# Altium project B2B_Charger.PrjPcb (part 1 of 3)
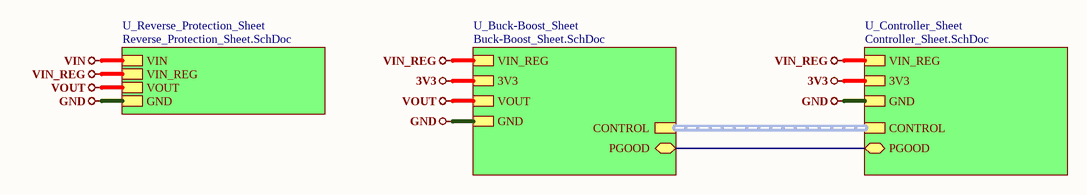
[diagram p0: Top_Sheet.SchDoc]
4 sheets, 112 parts. Net scope: hierarchical (ports join the sheet entries above them; power ports are global).
Sheets:
  Top_Sheet.SchDoc
    U_Controller_Sheet = Controller_Sheet.SchDoc
    U_Buck-Boost_Sheet = Buck-Boost_Sheet.SchDoc
    U_Reverse_Protection_Sheet = Reverse_Protection_Sheet.SchDoc

## Sheet Top_Sheet.SchDoc
size 420 x 297 mm; SheetNumber: 1; SheetTotal: 3

### Sub-sheets
U_Buck-Boost_Sheet = Buck-Boost_Sheet.SchDoc: CONTROL (harness CONTROL), PGOOD (bidir), GND, 3V3, VOUT, VIN_REG
U_Controller_Sheet = Controller_Sheet.SchDoc: CONTROL (harness CONTROL), PGOOD (bidir), GND, 3V3, VIN_REG
U_Reverse_Protection_Sheet = Reverse_Protection_Sheet.SchDoc: GND, VIN_REG, VIN, VOUT

### Nets
3V3: sheet U_Controller_Sheet/3V3, sheet U_Buck-Boost_Sheet/3V3
GND: sheet U_Controller_Sheet/GND, sheet U_Buck-Boost_Sheet/GND, sheet U_Reverse_Protection_Sheet/GND
VIN_REG: sheet U_Controller_Sheet/VIN_REG, sheet U_Buck-Boost_Sheet/VIN_REG, sheet U_Reverse_Protection_Sheet/VIN_REG
VOUT: sheet U_Buck-Boost_Sheet/VOUT, sheet U_Reverse_Protection_Sheet/VOUT
PGOOD: sheet U_Controller_Sheet/PGOOD, sheet U_Buck-Boost_Sheet/PGOOD

### Buses and harness runs
harness sheet U_Buck-Boost_Sheet/CONTROL = sheet U_Controller_Sheet/CONTROL

### Notes on the sheet
- File:
- Title:
- Date:
- Page
- Num:
- Total:
- Drawn By: Huzaifa Ali

## Sheet Controller_Sheet.SchDoc
size 420 x 297 mm; SheetNumber: 4; SheetTotal: 4
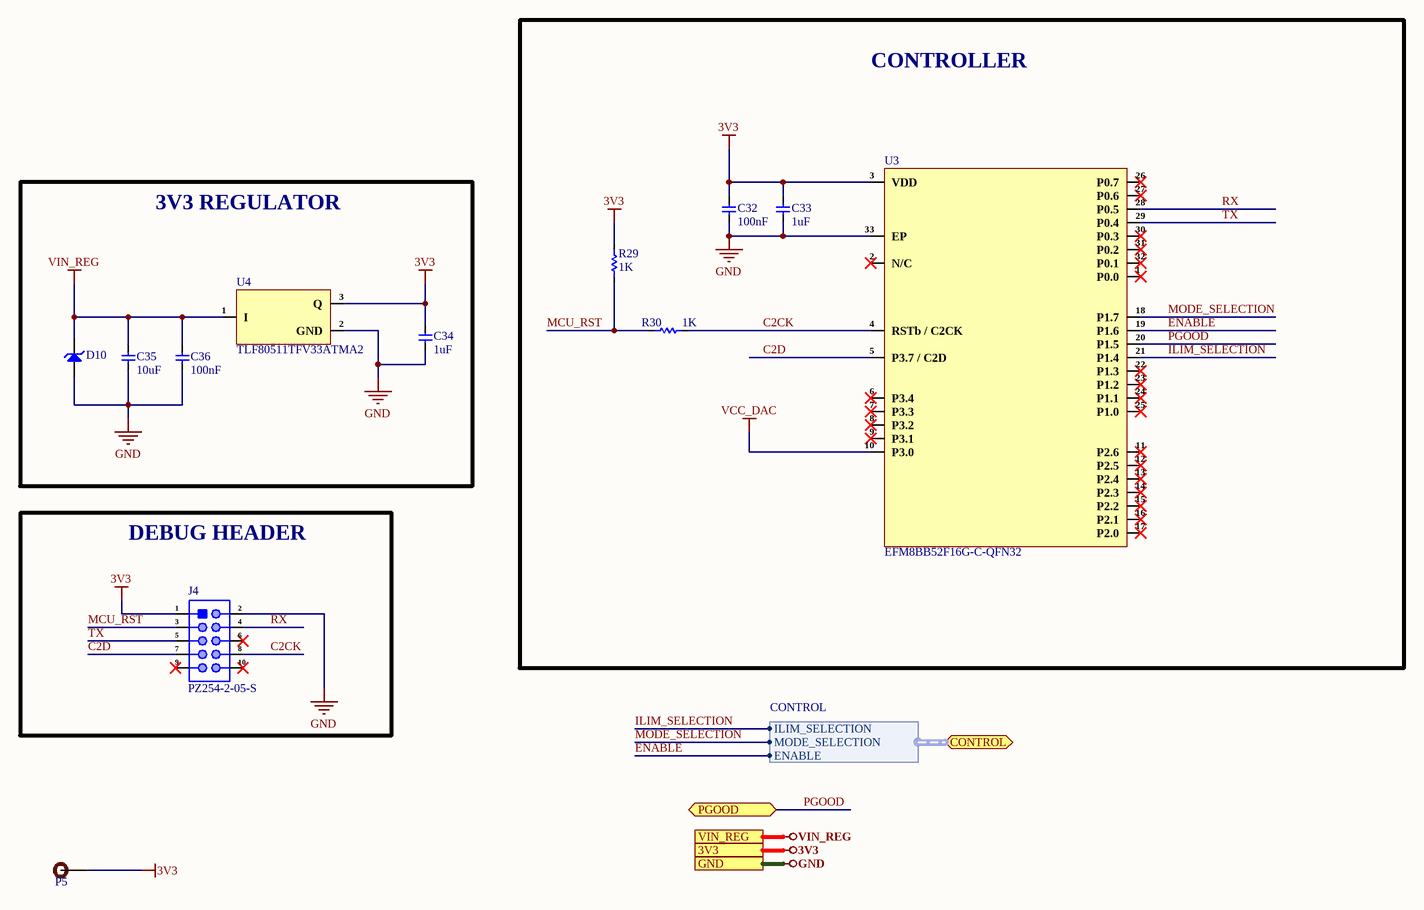
[diagram p1: Controller_Sheet.SchDoc]

### Parts
C32  100nF  [Cap-0603]
C33  1uF  [Cap-0603]
C34  1uF  [Cap-0603]
C35  10uF  [Cap-1206]
C36  100nF  [Cap-0603]
D10  1SMA5937BT3G  [SMA]  (value not drawn)
J4  PZ254-2-05-S  [PZ254-2-05-S]
P5  TEST POINT  [Test-point]  (value not drawn)  (no BOM)
R29  1K  [Res-0603]
R30  1K  [Res-0603]
U3  EFM8BB52F16G-C-QFN32  [32-QFN (5x5)]
U4  TLF80511TFV33ATMA2  [TO-252-2L]

### Blocks framed on the sheet
CONTROLLER: C32 C33 R29 R30 U3
3V3 REGULATOR: C34-C36 D10 U4
DEBUG HEADER: J4

### Ports
3V3, CONTROL (bidir, harness CONTROL), GND, PGOOD (bidir), VIN_REG

### Harnesses
CONTROL: ILIM_SELECTION, MODE_SELECTION, ENABLE

### Nets
3V3: C32.2 C33.2 C34.2 J4.1 P5.1 R29.2 U3.3(VDD) U4.3(Q) ; port 3V3
GND: C32.1 C33.1 C34.1 C35.1 C36.1 D10.2(A) J4.2 U3.33(EP) U4.2(GND) ; port GND
VCC_DAC: U3.10(P3.0)
VIN_REG: C35.2 C36.2 D10.1(K) U4.1(I) ; port VIN_REG
C2CK: J4.8 R30.2 U3.4(RSTb_/_C2CK)
C2D: J4.7 U3.5(P3.7_/_C2D)
ENABLE: U3.19(P1.6) ; port CONTROL.ENABLE
ILIM_SELECTION: U3.21(P1.4) ; port CONTROL.ILIM_SELECTION
MCU_RST: J4.3 R29.1 R30.1
MODE_SELECTION: U3.18(P1.7) ; port CONTROL.MODE_SELECTION
PGOOD: U3.20(P1.5) ; port PGOOD
RX: J4.4 U3.28(P0.5)
TX: J4.5 U3.29(P0.4)

Not connected (* = marked no-connect by the designer): J4 6* 9* 10*; U3 1(P0.0)* 2(N/C)* 6(P3.4)* 7(P3.3)* 8(P3.2)* 9(P3.1)* 11(P2.6)* 12(P2.5)* 13(P2.4)* 14(P2.3)* 15(P2.2)* 16(P2.1)* 17(P2.0)* 22(P1.3)* 23(P1.2)* 24(P1.1)* 25(P1.0)* 26(P0.7)* 27(P0.6)* 30(P0.3)* 31(P0.2)* 32(P0.1)*

### Notes on the sheet
- File:
- Title:
- Date:
- Page
- Num:
- Total:
- Drawn By: Huzaifa Ali

### Library data of the parts
C32 C36 = CC0603KRX5R9BB104: CAP CER 0.1UF 50V X5R 0603; Manufacturer: Yageo; Tolerance: 10%; Item Type: Capacitor; Supplier 1: Digi-Key; Manufacturer Part Number: CC0603KRX5R9BB104; RoHS: Yes; Category: Ceramic Capacitors; Stock 1: 152253; Pricing 1: 1=0.10000, 10=0.05200, 50=0.02820, 100=0.02310, 500=0.01648, 1000=0.01294 (USD); Mount: Surface Mount; Case/Package: 0603; Case Code (Imperial): 0603; Case Code (Metric): 1608; Weight: 7.1E-05oz; Min Operating Temperature: -55°C; Max Operating Temperature: 85°C; Capacitance: 100nF; Packaging: Tape and Reel; Voltage Rating: 50V; Dielectric: X5R; Termination: SMD/SMT; Voltage Rating (DC): 50V; Package Quantity: 4000; Length: 0.063inch; Width: 0.031inch; Thickness: 0.035inch; Lead Free: Lead Free; Halogen Free: Halogen Free; ComponentLink1URL: http://www.mouser.com/ds/2/447/Yageo_UPY-GP_NP0_16V-to-50V_9-358835.pdf?src-supplier=Mouser; ComponentLink1Description: http://www.mouser.com/ds/2/447/Yageo_UPY-GP_NP0_16V-to-50V_9-358835.pdf?src-supplier=Mouser; ComponentLink2URL: https://www.yageo.com/upload/media/product/productsearch/datasheet/mlcc/UPY-GPHC_X5R_4V-to-50V_26.pdf?src-supplier=Digi-Key; ComponentLink2Description: https://www.yageo.com/upload/media/product/productsearch/datasheet/mlcc/UPY-GPHC_X5R_4V-to-50V_26.pdf?src-supplier=Digi-Key; ComponentLink3URL: http://www.yageo.com/exep/pages/download/literatures/ProductSelectionGuide%202014_Final_2.pdf?src-supplier=Digi-Key; ComponentLink3Description: http://www.yageo.com/exep/pages/download/literatures/ProductSelectionGuide%202014_Final_2.pdf?src-supplier=Digi-Key; Supplier Part Number 1: 311-4046-1-ND; LCSC Part Number: C110022
C33 C34 = CC0603KRX5R8BB105: CAP CER 1UF 25V X5R 0603; Manufacturer: Yageo; Tolerance: 10%; Item Type: Capacitor; Supplier 1: Digi-Key; Manufacturer Part Number: CC0603KRX5R8BB105; RoHS: Yes; Category: Ceramic Capacitors; Stock 1: 919939; Pricing 1: 1=0.12000, 10=0.08400, 50=0.04760, 100=0.03940, 500=0.02764, 1000=0.02288 (USD); Mount: Surface Mount; Case/Package: 0603; Number of Pins: 2; Case Code (Metric): 1608; Case Code (Imperial): 0603; Min Operating Temperature: -55°C; Max Operating Temperature: 85°C; Capacitance: 1uF; Dielectric: X5R; Package Quantity: 1; Voltage Rating: 25V; Packaging: Tape and Reel; Termination: SMD/SMT; Voltage Rating (DC): 25V; Series: CC; Construction: Flat; Length: 1.6mm; Width: 0.031inch; Height: 0.8mm; Thickness: 0.035inch; Depth: 0.8mm; Radiation Hardening: No; REACH SVHC: No SVHC; Lead Free: Lead Free; Halogen Free: Halogen Free; RoHS Compliant: Yes; ComponentLink1URL: https://datasheet.ciiva.com/176/mlccorderingcode-176785.pdf?src-supplier=Digi-Key; ComponentLink1Description: https://datasheet.ciiva.com/176/mlccorderingcode-176785.pdf?src-supplier=Digi-Key; ComponentLink2URL: https://datasheet.ciiva.com/176/mlccorderingcode-176786.pdf?src-supplier=Digi-Key; ComponentLink2Description: https://datasheet.ciiva.com/176/mlccorderingcode-176786.pdf?src-supplier=Digi-Key; ComponentLink3URL: https://datasheet.ciiva.com/176/mlccorderingcode-176787.pdf?src-supplier=Digi-Key; ComponentLink3Description: https://datasheet.ciiva.com/176/mlccorderingcode-176787.pdf?src-supplier=Digi-Key; ComponentLink4URL: https://datasheet.ciiva.com/17436/upy-gphc-x5r-4v-to-50v-12-17436952.pdf?src-supplier=Avnet+Europe; ComponentLink4Description: https://datasheet.ciiva.com/17436/upy-gphc-x5r-4v-to-50v-12-17436952.pdf?src-supplier=Avnet+Europe; ComponentLink5URL: https://datasheet.ciiva.com/7978/1525783-7978171.pdf?src-supplier=Element14; ComponentLink5Description: https://datasheet.ciiva.com/7978/1525783-7978171.pdf?src-supplier=Element14; ComponentLink6URL: https://datasheet.ciiva.com/11586/upy-gphc-x5r-4v-to-50v-12-11586318.pdf?src-supplier=Avnet; ComponentLink6Description: https://datasheet.ciiva.com/11586/upy-gphc-x5r-4v-to-50v-12-11586318.pdf?src-supplier=Avnet; Supplier Part Number 1: 311-1445-1-ND; LCSC Part Number: C14664
C35 = CC1206KKX5R8BB106: CAP CER 10UF 25V X5R 1206; Manufacturer: Yageo; Tolerance: 10%; Supplier 1: Digi-Key; Manufacturer Part Number: CC1206KKX5R8BB106; RoHS: Yes; Category: Ceramic Capacitors; Stock 1: 206954; Pricing 1: 1=0.56000, 10=0.39800, 50=0.30080, 100=0.26190, 500=0.19402, 1000=0.16492 (USD); Mount: Surface Mount; Case/Package: 1206; Number of Pins: 2; Case Code (Imperial): 1206; Case Code (Metric): 3216; Min Operating Temperature: -55°C; Max Operating Temperature: 85°C; Capacitance: 10uF; Dielectric: X5R; Packaging: Tape and Reel; Voltage Rating: 25V; Package Quantity: 1; Termination: SMD/SMT; Voltage Rating (DC): 25V; Series: CC; Construction: Flat; Length: 3.2mm; Width: 0.063inch; Height: 1.6mm; Thickness: 0.071inch; Depth: 1.6mm; Radiation Hardening: No; Lead Free: Lead Free; Halogen Free: Halogen Free; RoHS Compliant: Yes; ComponentLink1URL: https://datasheet.ciiva.com/184/mlccorderingcode-184043.pdf?src-supplier=Digi-Key; ComponentLink1Description: https://datasheet.ciiva.com/184/mlccorderingcode-184043.pdf?src-supplier=Digi-Key; ComponentLink2URL: https://datasheet.ciiva.com/184/mlccorderingcode-184042.pdf?src-supplier=Digi-Key; ComponentLink2Description: https://datasheet.ciiva.com/184/mlccorderingcode-184042.pdf?src-supplier=Digi-Key; ComponentLink3URL: https://datasheet.ciiva.com/184/mlccorderingcode-184044.pdf?src-supplier=Digi-Key; ComponentLink3Description: https://datasheet.ciiva.com/184/mlccorderingcode-184044.pdf?src-supplier=Digi-Key; ComponentLink4URL: https://datasheet.ciiva.com/11466/upy-gphc-x5r-4v-to-50v-12-11466558.pdf?src-supplier=Avnet; ComponentLink4Description: https://datasheet.ciiva.com/11466/upy-gphc-x5r-4v-to-50v-12-11466558.pdf?src-supplier=Avnet; ComponentLink5URL: https://datasheet.ciiva.com/15189/getdatasheetpartid-344055-15189254.pdf?src-supplier=Verical; ComponentLink5Description: https://datasheet.ciiva.com/15189/getdatasheetpartid-344055-15189254.pdf?src-supplier=Verical; Supplier Part Number 1: 311-1466-1-ND
D10 = 1SMA5937BT3G: DIODE ZENER 33V 1.5W SMA; Manufacturer: ON Semiconductor; Supplier: Rs; Supplier Part Number: 7925363; Manufacturer Part Number: 1SMA5937BT3G; RoHS: Yes; Category: Zener Diodes; Stock: 3380; Pricing: 20=0.231, 100=0.164, 200=0.159, 400=0.154, 800=0.152 (GBP); ComponentLink1URL: https://datasheet.ciiva.com/30478/0900766b8127698c-30478606.pdf?src-supplier=Rs; ComponentLink1Description: https://datasheet.ciiva.com/30478/0900766b8127698c-30478606.pdf?src-supplier=Rs; ComponentLink2URL: https://datasheet.ciiva.com/1182/1sma5913bt3-d-1182598.pdf?src-supplier=Element14; ComponentLink2Description: https://datasheet.ciiva.com/1182/1sma5913bt3-d-1182598.pdf?src-supplier=Element14; ComponentLink3URL: https://datasheet.ciiva.com/1182/1sma5913bt3-d-1182599.pdf?src-supplier=Element14; ComponentLink3Description: https://datasheet.ciiva.com/1182/1sma5913bt3-d-1182599.pdf?src-supplier=Element14; Item Type: Diode
J4 = PZ254-2-05-S: 250V 3A Brick nogging Square Pins 2.5mm 260℃@5S 6mm 10P -40℃~+105℃ 2.54mm 双排 Black 2.54mm 2x5P SMD,P=2.54mm Pin Headers ROHS; Manufacturer: HCTL; Item Type: Male Header; Manufacturer Part Number: PZ254-2-05-S; LCSC Part Number: C3294463
P5 = TEST POINT: Test Point ON; Item Type: TEST POINT
R29 R30 = RT0603BRD071KL: RES SMD 1K OHM 0.1% 1/10W 0603; Manufacturer: Yageo; Resistance: 1kR; Power Rating: 100mW; Voltage Rating: 75V; Temperature Coefficient: 25ppm/°C; Voltage Rating (DC): 50V; Item Type: Resistor; Supplier 1: Arrow Electronics; Manufacturer Part Number: RT0603BRD071KL; RoHS: Yes; Category: Chip SMD Resistors; Stock 1: 130000; Pricing 1: 5000=0.03900, 10000=0.03450, 25000=0.03070, 50000=0.02040 (USD); Mount: Surface Mount; Case/Package: 0603; Case Code (Metric): 1608; Case Code (Imperial): 0603; Contact Plating: Tin,Lead; Size Code: 0603; Min Operating Temperature: -55°C; Max Operating Temperature: 125°C; Package Quantity: 5000; Packaging: Tape and Reel; Resistor Type: Thin Film; Number of Terminations: 2; Termination: SMD/SMT; Max Power Dissipation: 100mW; Features: Moisture Resistant; Series: RT; Technology: THIN FILM; Construction: Rectangular; Length: 1.6mm; Width: 0.031inch; Height: 0.022inch; Depth: 0.8mm; Military Standard: Not; Lead Free: Lead Free; RoHS Compliant: Yes; ComponentLink1URL: https://datasheet.ciiva.com/11819/0900766b8079c86e-11819652.pdf?src-supplier=RSComponents; ComponentLink1Description: https://datasheet.ciiva.com/11819/0900766b8079c86e-11819652.pdf?src-supplier=RSComponents; ComponentLink2URL: https://datasheet.ciiva.com/5624/pyu-rt-1-to-0-05-rohs-l-4-5624759.pdf?src-supplier=Mouser; ComponentLink2Description: https://datasheet.ciiva.com/5624/pyu-rt-1-to-0-05-rohs-l-4-5624759.pdf?src-supplier=Mouser; ComponentLink3URL: https://datasheet.ciiva.com/29718/pyu-rt-1-to-0-05-rohs-l-4-29718010.pdf?src-supplier=Digi-Key; ComponentLink3Description: https://datasheet.ciiva.com/29718/pyu-rt-1-to-0-05-rohs-l-4-29718010.pdf?src-supplier=Digi-Key; ComponentLink4URL: https://datasheet.ciiva.com/29718/pyu-rt-1-to-0-05-rohs-l-4-29718011.pdf?src-supplier=Digi-Key; ComponentLink4Description: https://datasheet.ciiva.com/29718/pyu-rt-1-to-0-05-rohs-l-4-29718011.pdf?src-supplier=Digi-Key; Supplier Part Number 1: RT0603BRD071KL; LCSC Part Number: C110776
U3 = EFM8BB52F16G-C-QFN32: IC MCU 8BIT 16KB FLASH 32QFN; Manufacturer: Silicon Labs; Supplier: Arrow Electronics; Supplier Part Number: EFM8BB52F16G-C-QFN32; Manufacturer Part Number: EFM8BB52F16G-C-QFN32; RoHS: No; Category: Uncategorized; Stock: 540; Pricing: 1=0.5847, 10=0.5643, 100=0.5088, 600=0.5037, 1000=0.48 (USD); Item Type: IC
U4 = TLF80511TFV33ATMA2: IC REG LIN 3.3V 400MA TO252-3-11; Manufacturer: Infineon; Supplier: Future Electronics; Supplier Part Number: 6060699; Manufacturer Part Number: TLF80511TFV33ATMA2; RoHS: Yes; Pricing: 2500=0.745 (USD); RoHS Compliant: Yes; Item Type: IC

## Sheet Buck-Boost_Sheet.SchDoc
size 420 x 297 mm; SheetNumber: 3; SheetTotal: 4
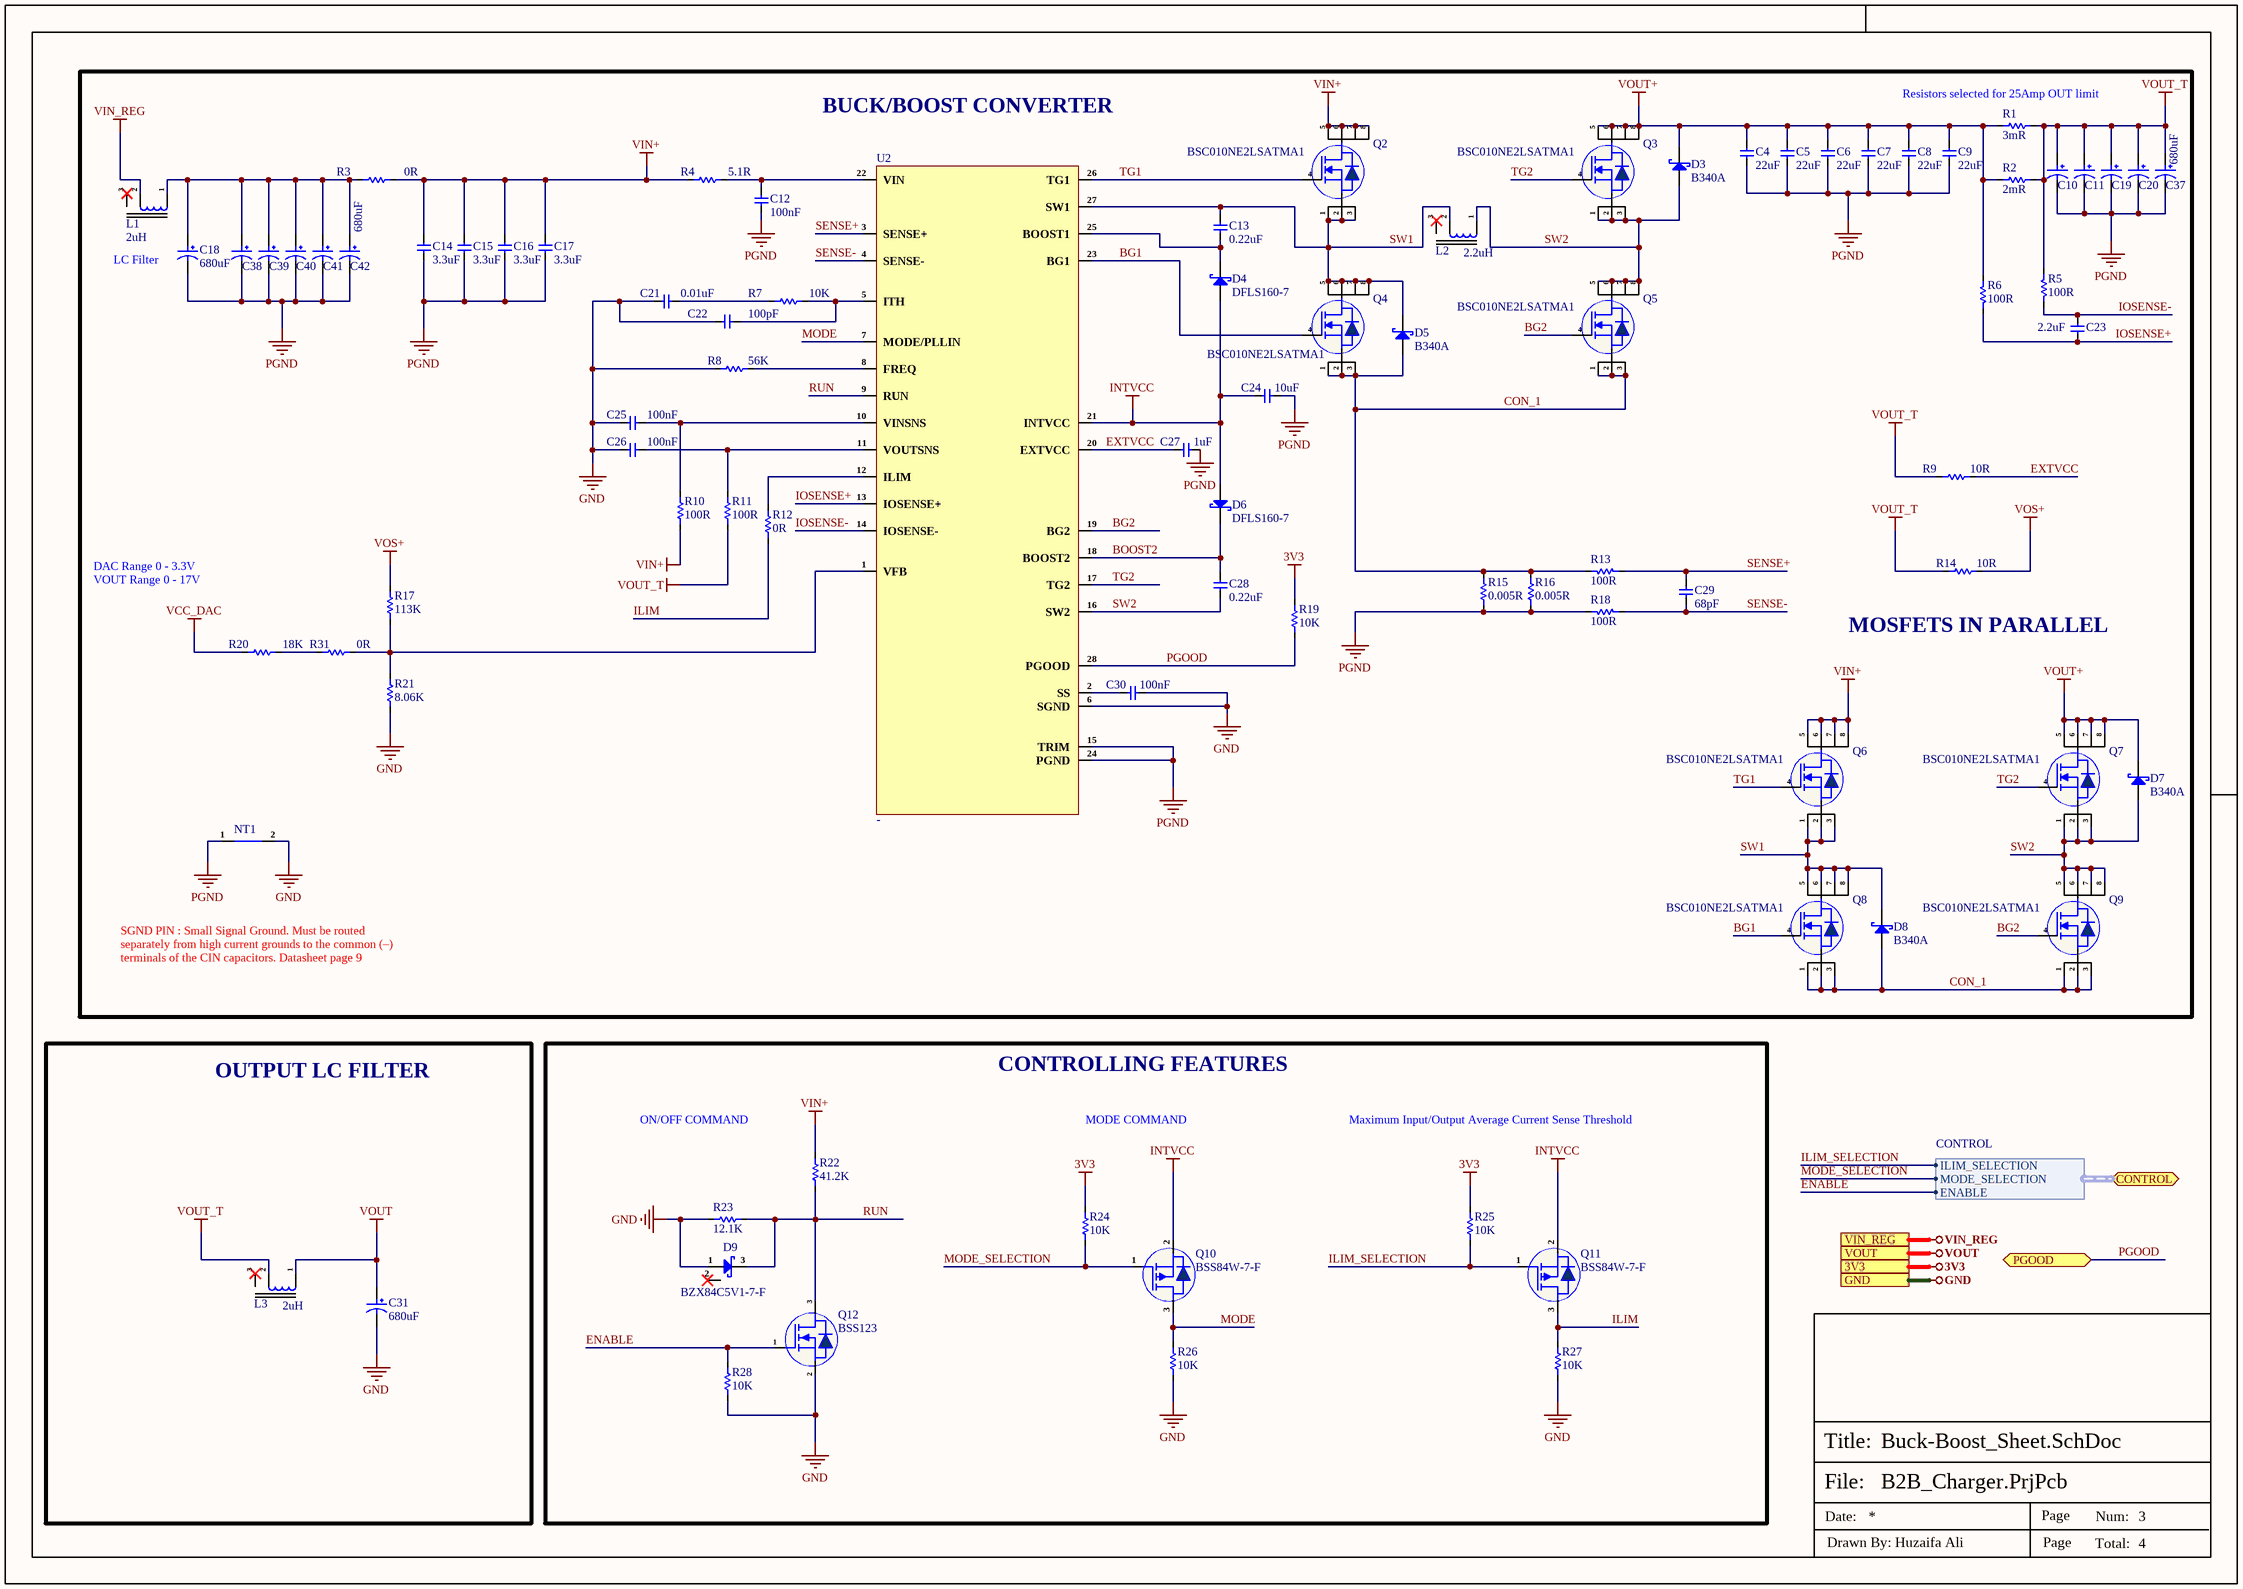
[diagram p2: Buck-Boost_Sheet.SchDoc]

### Parts
C4  22uF  [Cap-1206]
C5  22uF  [Cap-1206]
C6  22uF  [Cap-1206]
C7  22uF  [Cap-1206]
C8  22uF  [Cap-1206]
C9  22uF  [Cap-1206]
C10  680uF  [50PX680MEFC12.5X20]  (value not drawn)
C11  680uF  [50PX680MEFC12.5X20]  (value not drawn)
C12  100nF  [Cap-0603]
C13  0.22uF  [Cap-0402]
C14  3.3uF  [Cap-1210]
C15  3.3uF  [Cap-1210]
C16  3.3uF  [Cap-1210]
C17  3.3uF  [Cap-1210]
C18  680uF  [50PX680MEFC12.5X20]
C19  680uF  [50PX680MEFC12.5X20]  (value not drawn)
C20  680uF  [50PX680MEFC12.5X20]  (value not drawn)
C21  0.01uF  [Cap-0603]
C22  100pF  [Cap-0603]
C23  2.2uF  [CAP-0603]
C24  10uF  [Cap-1206]
C25  100nF  [Cap-0603]
C26  100nF  [Cap-0603]
C27  1uF  [Cap-0603]
C28  0.22uF  [Cap-0402]
C29  68pF  [Cap-0603]
C30  100nF  [Cap-0603]
C31  680uF  [50PX680MEFC12.5X20]
C37  680uF  [50PX680MEFC12.5X20]
C38  680uF  [50PX680MEFC12.5X20]  (value not drawn)
C39  680uF  [50PX680MEFC12.5X20]  (value not drawn)
C40  680uF  [50PX680MEFC12.5X20]  (value not drawn)
C41  680uF  [50PX680MEFC12.5X20]  (value not drawn)
C42  680uF  [50PX680MEFC12.5X20]
D3  B340A  [SMA(DO-214AC)]
D4  DFLS160-7  [PowerDI123]
D5  B340A  [SMA(DO-214AC)]
D6  DFLS160-7  [PowerDI123]
D7  B340A  [SMA(DO-214AC)]
D8  B340A  [SMA(DO-214AC)]
D9  BZX84C5V1-7-F  [SOT-23]
L1  2uH  [SER2011-202MLD]
L2  2.2uH  [SER2915L-222KL]
L3  2uH  [SER2011-202MLD]
NT1  Net Tie_SMD  [Net Tie Pad]  (value not drawn)  (net tie, no BOM)
Q2  BSC010NE2LSATMA1  [PG-TDSON-8-7]
Q3  BSC010NE2LSATMA1  [PG-TDSON-8-7]
Q4  BSC010NE2LSATMA1  [PG-TDSON-8-7]
Q5  BSC010NE2LSATMA1  [PG-TDSON-8-7]
Q6  BSC010NE2LSATMA1  [PG-TDSON-8-7]
Q7  BSC010NE2LSATMA1  [PG-TDSON-8-7]
Q8  BSC010NE2LSATMA1  [PG-TDSON-8-7]
Q9  BSC010NE2LSATMA1  [PG-TDSON-8-7]
Q10  BSS84W-7-F  [SOT-323]
Q11  BSS84W-7-F  [SOT-323]
Q12  BSS123  [SOT-23]
R1  3mR  [RES-2512]
R2  2mR  [RES-2512]
R3  0R  [RES-2512]
R4  5.1R  [RES-0805]
R5  100R  [Res-0603]
R6  100R  [Res-0603]
R7  10K  [Res-0603]
R8  56K  [Res-0603]
R9  10R  [Res-0603]
R10  100R  [Res-0603]
R11  100R  [Res-0603]
R12  0R  [Res-0603]
R13  100R  [Res-0603]
R14  10R  [Res-0603]
R15  0.005R  [RES-2512]
R16  0.005R  [RES-2512]
R17  113K  [Res-0603]
R18  100R  [Res-0603]
R19  10K  [Res-0603]
R20  18K  [Res-0603]
R21  8.06K  [Res-0603]
R22  41.2K  [Res-0603]
R23  12.1K  [Res-0603]
R24  10K  [Res-0603]
R25  10K  [Res-0603]
R26  10K  [Res-0603]
R27  10K  [Res-0603]
R28  10K  [Res-0603]
R31  0R  [Res-0805]
U2  -  [28-SSOP]

### Blocks framed on the sheet
OUTPUT LC FILTER: C31 L3
CONTROLLING FEATURES: D9 Q10-Q12 R22-R28

### Ports
3V3, CONTROL (bidir, harness CONTROL), GND, PGOOD (bidir), VIN_REG, VOUT

### Harnesses
CONTROL: ILIM_SELECTION, MODE_SELECTION, ENABLE

### Nets
3V3: R19.2 R24.2 R25.2 ; port 3V3
GND: C21.1 C22.1 C25.1 C26.1 C30.1 C31.2 D9.1(A) NT1.2 Q12.2(S) R8.1 R21.1 R23.1 R26.1 R27.1 R28.1 U2.6(SGND) ; port GND
INTVCC: C24.1 D4.1(A) D6.1(A) Q10.2(S) Q11.2(S) U2.21(INTVCC)
PGND: C4.1 C5.1 C6.1 C7.1 C8.1 C9.1 C10.2 C11.2 C12.1 C14.1 C15.1 C16.1 C17.1 C18.2 C19.2 C20.2 C24.2 C27.2 C37.2 C38.2 C39.2 C40.2 C41.2 C42.2 NT1.1 R15.1 R16.1 R18.1 U2.15(TRIM) U2.24(PGND)
VCC_DAC: R20.2
VIN+: C14.2 C15.2 C16.2 C17.2 Q2.5(D) Q2.6(D) Q2.7(D) Q2.8(D) Q6.5(D) Q6.6(D) Q6.7(D) Q6.8(D) R3.2 R4.1 R10.1 R22.2
VIN_REG: L1.2 ; port VIN_REG
VOS+: R14.2 R17.2
VOUT: C31.1 L3.1 ; port VOUT
VOUT+: C4.2 C5.2 C6.2 C7.2 C8.2 C9.2 D3.1(K) D7.1(K) Q3.5(D) Q3.6(D) Q3.7(D) Q3.8(D) Q7.5(D) Q7.6(D) Q7.7(D) Q7.8(D) R1.1 R2.1 R6.2
VOUT_T: C10.1 C11.1 C19.1 C20.1 C37.1 L3.2 R1.2 R2.2 R5.2 R9.1 R11.1 R14.1
BG1: Q4.4(G) Q8.4(G) U2.23(BG1)
BG2: Q5.4(G) Q9.4(G) U2.19(BG2)
BOOST2: C28.2 D6.2(K) U2.18(BOOST2)
CON_1: D5.2(A) D8.2(A) Q4.1(S) Q4.2(S) Q4.3(S) Q5.1(S) Q5.2(S) Q5.3(S) Q8.1(S) Q8.2(S) Q8.3(S) Q9.1(S) Q9.2(S) Q9.3(S) R13.1 R15.2 R16.2
ENABLE: Q12.1(G) R28.2 ; port CONTROL.ENABLE
EXTVCC: C27.1 R9.2 U2.20(EXTVCC)
ILIM: Q11.3(D) R12.1 R27.2
ILIM_SELECTION: Q11.1(G) R25.1 ; port CONTROL.ILIM_SELECTION
IOSENSE+: C23.1 R6.1 U2.13(IOSENSE+)
IOSENSE-: C23.2 R5.1 U2.14(IOSENSE-)
MODE: Q10.3(D) R26.2 U2.7(MODE/PLLIN)
MODE_SELECTION: Q10.1(G) R24.1 ; port CONTROL.MODE_SELECTION
PGOOD: R19.1 U2.28(PGOOD) ; port PGOOD
RUN: D9.3(K) Q12.3(D) R22.1 R23.2 U2.9(RUN)
SENSE+: C29.2 R13.2 U2.3(SENSE+)
SENSE-: C29.1 R18.2 U2.4(SENSE-)
SW1: C13.2 D5.1(K) D8.1(K) L2.2 Q2.1(S) Q2.2(S) Q2.3(S) Q4.5(D) Q4.6(D) Q4.7(D) Q4.8(D) Q6.1(S) Q6.2(S) Q6.3(S) Q8.5(D) Q8.6(D) Q8.7(D) Q8.8(D) U2.27(SW1)
SW2: C28.1 D3.2(A) D7.2(A) L2.1 Q3.1(S) Q3.2(S) Q3.3(S) Q5.5(D) Q5.6(D) Q5.7(D) Q5.8(D) Q7.1(S) Q7.2(S) Q7.3(S) Q9.5(D) Q9.6(D) Q9.7(D) Q9.8(D) U2.16(SW2)
TG1: Q2.4(G) Q6.4(G) U2.26(TG1)
TG2: Q3.4(G) Q7.4(G) U2.17(TG2)
NetC12_2: C12.2 R4.2 U2.22(VIN)
NetC13_1: C13.1 D4.2(K) U2.25(BOOST1)
NetC18_1: C18.1 C38.1 C39.1 C40.1 C41.1 C42.1 L1.1 R3.1
NetC21_2: C21.2 R7.1
NetC22_2: C22.2 R7.2 U2.5(ITH)
NetC25_2: C25.2 R10.2 U2.10(VINSNS)
NetC26_2: C26.2 R11.2 U2.11(VOUTSNS)
NetC30_2: C30.2 U2.2(SS)
NetR8_2: R8.2 U2.8(FREQ)
NetR12_2: R12.2 U2.12(ILIM)
NetR17_1: R17.1 R21.2 R31.2 U2.1(VFB)
NetR20_1: R20.1 R31.1

Not connected (* = marked no-connect by the designer): D9 2(NC)*; L1 3*; L2 3*; L3 3*

### Notes on the sheet
- BUCK/BOOST CONVERTER
- (near R1) Resistors selected for 25Amp OUT limit
- (near C18) LC Filter
- DAC Range 0 - 3.3V
  VOUT Range 0 - 17V
- (near R14) MOSFETS IN PARALLEL
- SGND PIN : Small Signal Ground. Must be routed separately from high current grounds to the common (–) terminals of the CIN capacitors. Datasheet page 9
- ON/OFF COMMAND
- MODE COMMAND
- Maximum Input/Output Average Current Sense Threshold
- File:
- Title:
- Date:
- Page
- Num:
- Total:
- Drawn By: Huzaifa Ali